# EasyEDA Pro project project.epro, schematic Pakshi
Board Name: Board1; Create Date: 2026-10-31; Page Name: schematic; Project Name: mini dron; Schematic Name: Pakshi; Update Date: 2026-10-31; Company: EasyEDA.com; Page Size: A4; Version: V1.0
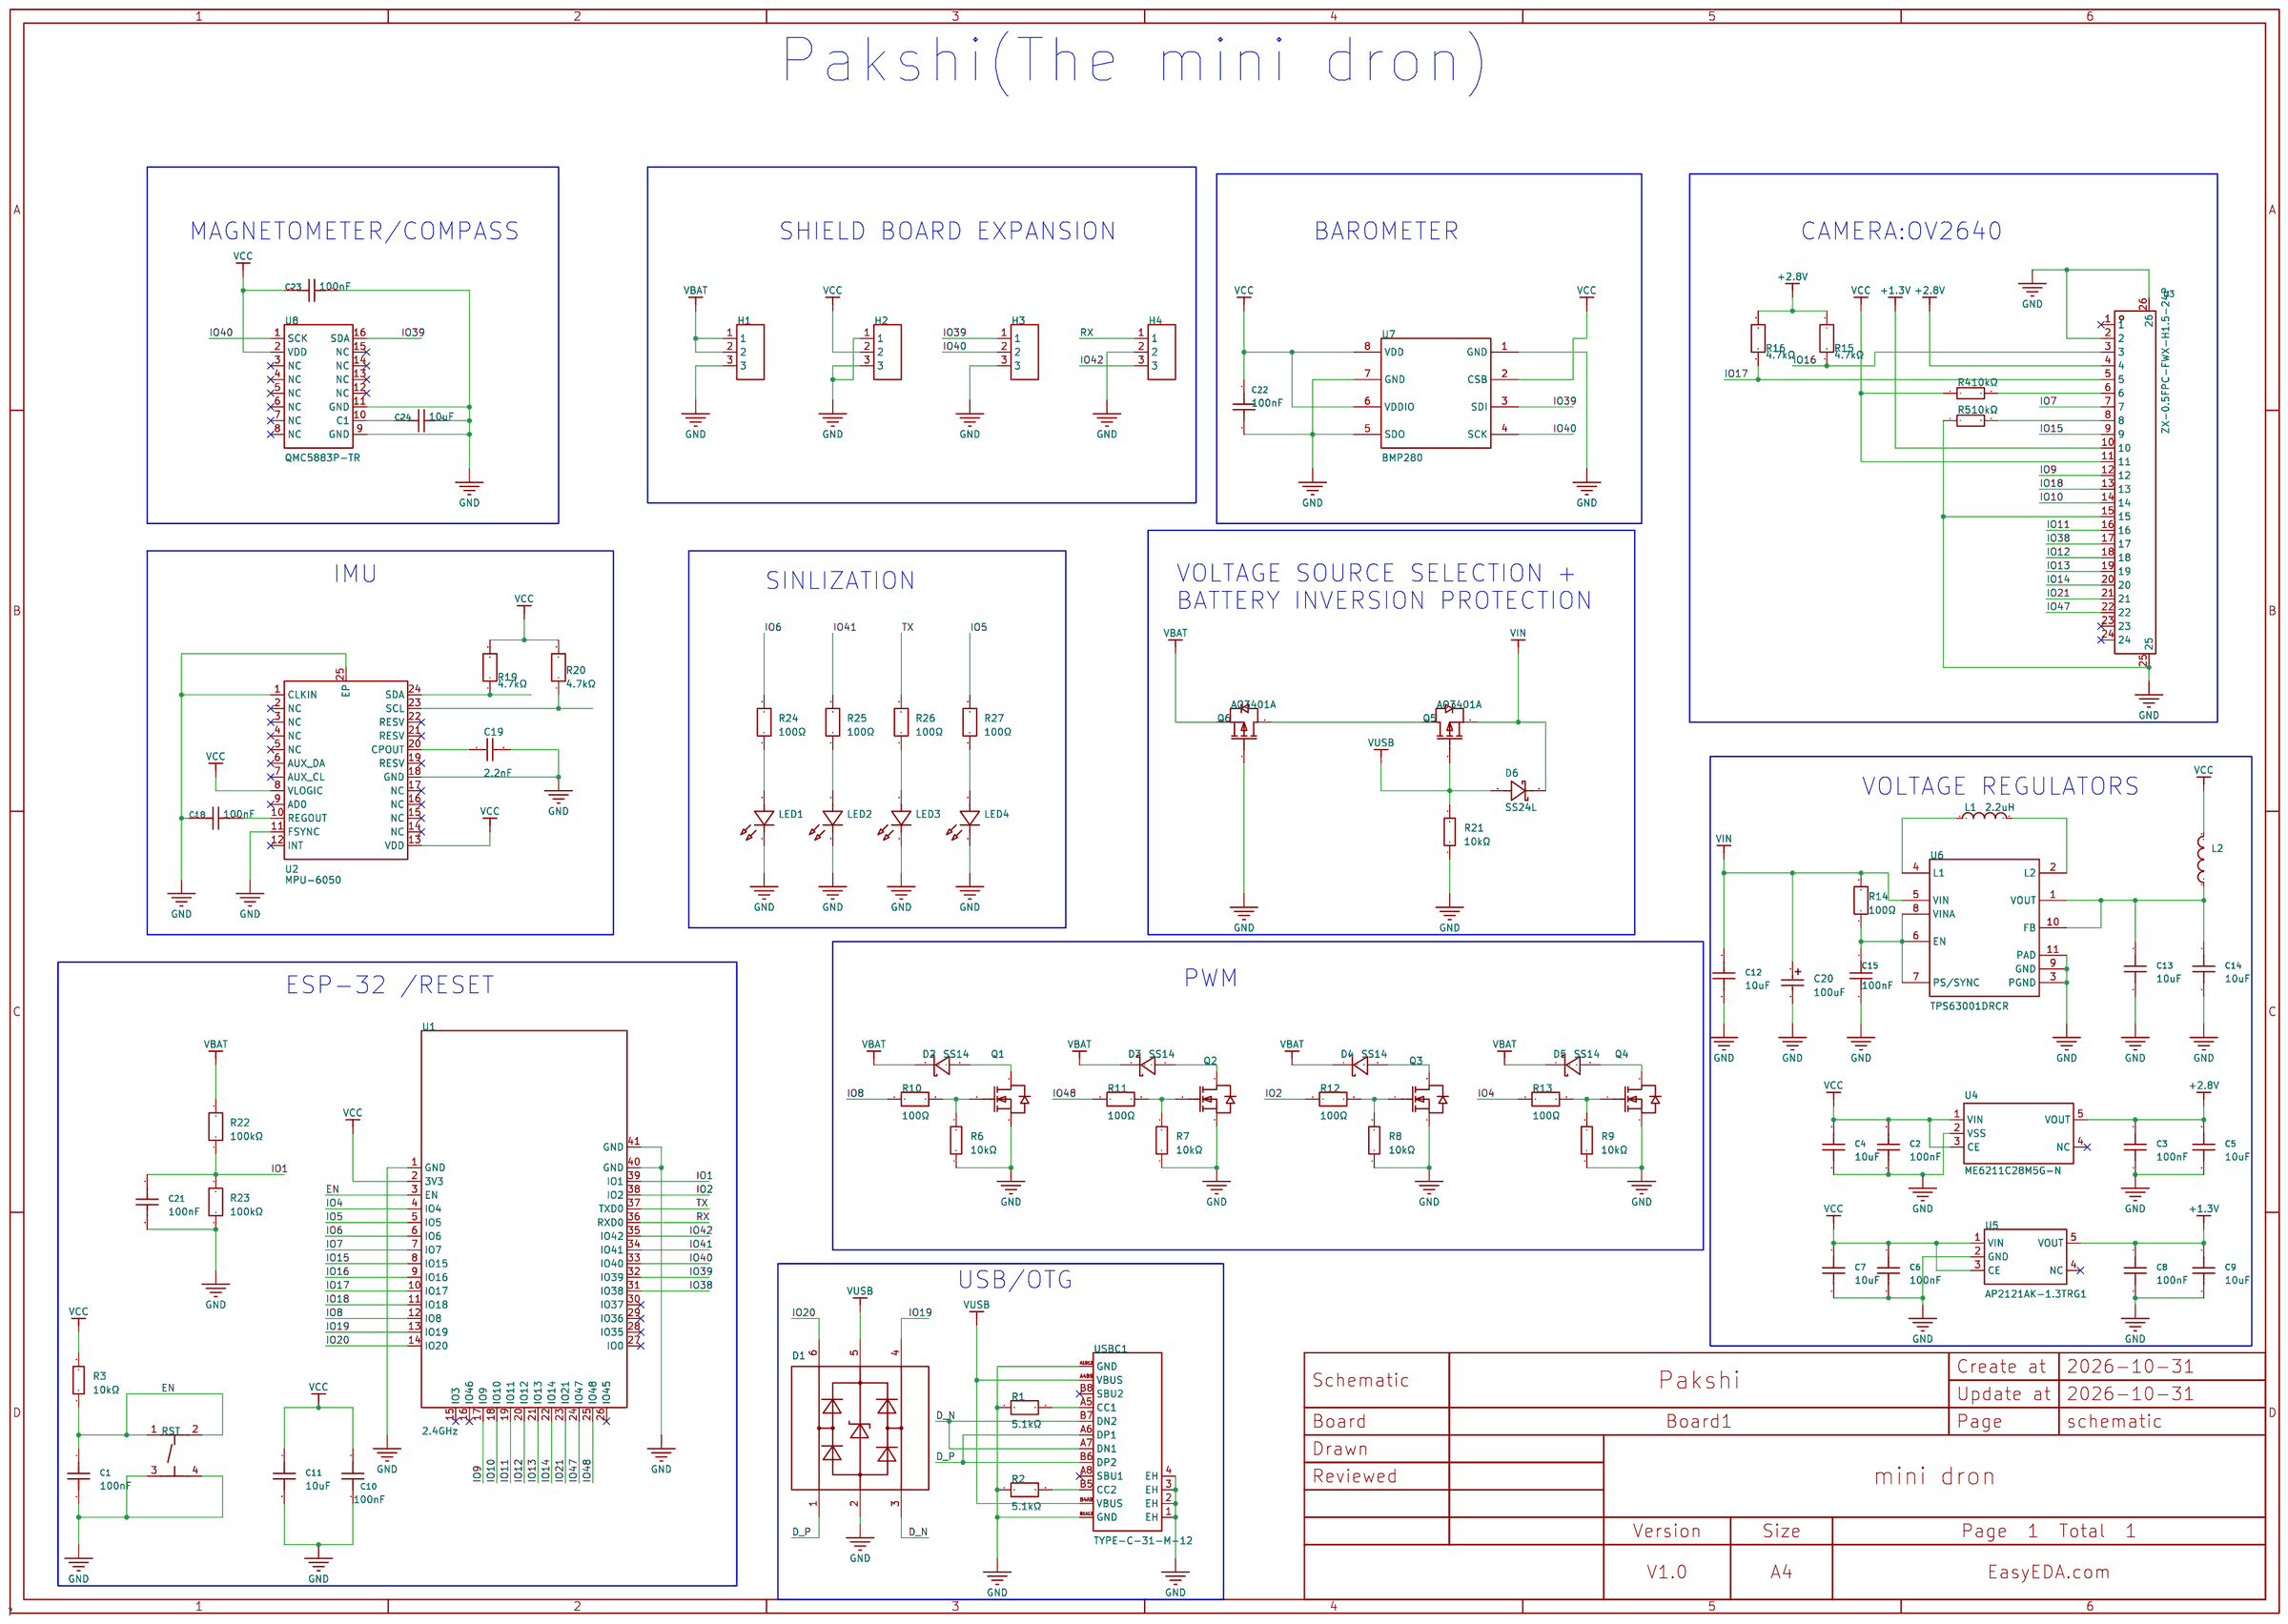
[diagram p0: schematic sheet]

## Parts
C1  100nF  [C0603]
C2  100nF  [C0603]
C3  100nF  [C0603]
C4  10uF  [C0603]
C5  10uF  [C0603]
C6  100nF  [C0603]
C7  10uF  [C0603]
C8  100nF  [C0603]
C9  10uF  [C0603]
C10  100nF  [C0603]
C11  10uF  [C0603]
C12  10uF  [C0603]
C13  10uF  [C0603]
C14  10uF  [C0603]
C15  100nF  [C0603]
C18  100nF  [C0603]
C19  2.2nF  [C0603]
C20  100uF  [CASE-B_3528]
C21  100nF  [C0603]
C22  100nF  [C0603]
C23  100nF  [C0603]
C24  10uF  [C0603]
D1  USBLC6-2SC6  [SOT-23-6_L2.9-W1.6-P0.95-LS2.8-BL]
D2  SS14  [SMA_L4.3-W2.6-LS5.2-RD]
D3  SS14  [SMA_L4.3-W2.6-LS5.2-RD]
D4  SS14  [SMA_L4.3-W2.6-LS5.2-RD]
D5  SS14  [SMA_L4.3-W2.6-LS5.2-RD]
D6  SS24L  [SOD-123FL_L2.8-W1.8-LS3.7-R-RD]
H1  B12720520-3PB0514-H10C43  [HDR-SMD_3P-P1.27-V-M-LS4.2_X1311WVS-R2]
H2  B12720520-3PB0514-H10C43  [HDR-SMD_3P-P1.27-V-M-LS4.2_X1311WVS-R2]
H3  B12720520-3PB0514-H10C43  [HDR-SMD_3P-P1.27-V-M-LS4.2_X1311WVS-R2]
H4  B12720520-3PB0514-H10C43  [HDR-SMD_3P-P1.27-V-M-LS4.2_X1311WVS-R2]
L1  2.2uH  [IND-SMD_L3.0-W3.0_SMNR3015]
L2  BLM18HB121SN1D  [L0603]
LED1  XL-1608SURC-06  [LED0603-RD_RED]
LED2  19-219/GHC-YR2T1B5Y/3T  [LED-SMD_L1.6-W0.8_19-219-GHC-YR2T1B5Y-3T]
LED3  XL-1608SURC-06  [LED0603-RD_RED]
LED4  19-219/GHC-YR2T1B5Y/3T  [LED-SMD_L1.6-W0.8_19-219-GHC-YR2T1B5Y-3T]
Q1  AO3400A  [SOT-23-3_L2.9-W1.3-P1.90-LS2.4-BR]
Q2  AO3400A  [SOT-23-3_L2.9-W1.3-P1.90-LS2.4-BR]
Q3  AO3400A  [SOT-23-3_L2.9-W1.3-P1.90-LS2.4-BR]
Q4  AO3400A  [SOT-23-3_L2.9-W1.3-P1.90-LS2.4-BR]
Q5  AO3401A  [SOT-23_L2.9-W1.3-P1.90-LS2.4-BR]
Q6  AO3401A  [SOT-23_L2.9-W1.3-P1.90-LS2.4-BR]
R1  5.1kΩ  [R0603]
R2  5.1kΩ  [R0603]
R3  10kΩ  [R0603]
R4  10kΩ  [R0603]
R5  10kΩ  [R0603]
R6  10kΩ  [R0603]
R7  10kΩ  [R0603]
R8  10kΩ  [R0603]
R9  10kΩ  [R0603]
R10  100Ω  [R0603]
R11  100Ω  [R0603]
R12  100Ω  [R0603]
R13  100Ω  [R0603]
R14  100Ω  [R0603]
R15  4.7kΩ  [R0603]
R16  4.7kΩ  [R0603]
R19  4.7kΩ  [R0603]
R20  4.7kΩ  [R0603]
R21  10kΩ  [R0603]
R22  100kΩ  [R0603]
R23  100kΩ  [R0603]
R24  100Ω  [R0603]
R25  100Ω  [R0603]
R26  100Ω  [R0603]
R27  100Ω  [R0603]
RST  TS-1187A-B-A-B  [SW-SMD_4P-L5.1-W5.1-P3.70-LS6.5-TL_H1.5]
U1  2.4GHz  [WIRELM-SMD_ESP32-S3-WROOM-1]
U2  MPU-6050  [QFN-24_L4.0-W4.0-P0.50-BL-EP2.7]
U3  ZX-0.5FPC-FWX-H1.5-24P  [FPC-SMD_24P-P0.50_ZX-0.5FPC-FWX-H1.5-24P]
U4  ME6211C28M5G-N  [SOT-23-5_L3.0-W1.7-P0.95-LS2.8-BR]
U5  AP2121AK-1.3TRG1  [SOT-23-5_L2.9-W1.6-P0.95-LS2.8-BL]
U6  TPS63001DRCR  [VSON-10_L3.0-W3.0-P0.50-TL-EP_TPS62410DRCR]
U7  BMP280  [LGA-8_L2.5-W2.0-P0.65_AMP6127]
U8  QMC5883P-TR  [LGA-16_L3.0-W3.0-P0.50-BL_SQ]
USBC1  TYPE-C-31-M-12  [USB-C_SMD-TYPE-C-31-M-12_1]

## Library data of the parts
C1-C3 C6 C8 C10 C15 C18 C21-C23 = CC0603KRX7R7BB104: Capacitance:100nF Tolerance:±10% Tolerance:±10% Voltage Rating:16V Temperature Coefficient:X7R; LCSC Part Name: 100nF ±10% 16V; Supplier Part: C108079; Manufacturer: YAGEO(国巨); Supplier Footprint: 0603; JLCPCB Part Class: Extended Part; Datasheet: https://item.szlcsc.com/datasheet/CC0603KRX7R7BB104/109298.html; Supplier: LCSC; Tolerance: ±10%; Voltage Rating: 16V; Temperature Coefficient: X7R
C4 C5 C7 C9 C11-C14 C24 = GRM188Z71A106MA73D: Capacitance:10uF Tolerance:±20% Tolerance:±20% Voltage Rating:10V Temperature Coefficient:X7R; LCSC Part Name: 10uF ±20% 10V; Supplier Part: C237435; Manufacturer: muRata(村田); Supplier Footprint: 0603; JLCPCB Part Class: Extended Part; Datasheet: https://item.szlcsc.com/datasheet/GRM188Z71A106MA73D/236879.html; Supplier: LCSC; Tolerance: ±20%; Voltage Rating: 10V; Temperature Coefficient: X7R
C19 = CC0603KRX7R9BB222: Capacitance:2.2nF Tolerance:±10% Tolerance:±10% Voltage Rating:50V Temperature Coefficient:X7R; LCSC Part Name: 2.2nF ±10% 50V; Supplier Part: C107082; Manufacturer: YAGEO(国巨); Supplier Footprint: 0603; JLCPCB Part Class: Extended Part; Datasheet: https://item.szlcsc.com/datasheet/CC0603KRX7R9BB222/108298.html; Supplier: LCSC; Tolerance: ±10%; Voltage Rating: 50V; Temperature Coefficient: X7R
C20 = TAJB107M010RNJ: Capacitance:100uF Tolerance:±20% Tolerance:±20% Voltage Rating:10V Equivalent Series Resistance(ESR):1.4Ω@100kHz Operating Temperature:-55℃~+125℃ Operating Temperature:-55℃~+125℃; LCSC Part Name: 100uF ±20% 10V; Supplier Part: C7196; Manufacturer: Kyocera AVX; Supplier Footprint: CASE-B-3528-21(mm); JLCPCB Part Class: Extended Part; Supplier: LCSC; Tolerance: ±20%; Voltage Rating: 10V; Equivalent Series Resistance(ESR): 1.4Ω@100kHz; Operating Temperature: -55℃~+125℃
D1 = USBLC6-2SC6_C7519: Polarity:Unidirectional Reverse Stand-Off Voltage (Vrwm):5.25V Clamping Voltage:17V Peak Pulse Current (Ipp):5A Voltage - Breakdown:6V Reverse Leakage Current (Ir):150nA Number of Channels:2 Operating Temperature:-40℃~+125℃ Operating Temperature:-40℃~+125; LCSC Part Name: 单向ESD 5.25V截止 峰值脉冲电流：5A; Supplier Part: C7519; Manufacturer: ST(意法半导体); Supplier Footprint: SOT-23-6L; JLCPCB Part Class: Extended Part; Datasheet: https://item.szlcsc.com/datasheet/USBLC6-2SC6/7996.html; Supplier: LCSC; Polarity: Unidirectional; Reverse Stand-Off Voltage (Vrwm): 5.25V; Clamping Voltage: 17V; Peak Pulse Current (Ipp): 5A; Voltage - Breakdown: 6V; Reverse Leakage Current (Ir): 150nA; Number of Channels: 2; Operating Temperature: -40℃~+125℃; level of protection: IEC 61000-4-2; Type: ESD; Junction Capacitance: 3.5pF
D2-D5 = SS14_C83852: Voltage - Forward(Vf@If):500mV@1A Voltage - DC Reverse(Vr):40V Current - Rectified:1A Reverse Leakage Current (Ir):200uA@40V Operating Junction Temperature Range:-65℃~+125℃ Operating Junction Temperature Range:-65℃~+125℃ Non-Repetitive Peak Forward Surge; LCSC Part Name: 电压:40V 电流:1A; Supplier Part: C83852; Manufacturer: onsemi(安森美); Supplier Footprint: SMA(DO-214AC); JLCPCB Part Class: Extended Part; Datasheet: https://item.szlcsc.com/datasheet/SS14/85019.html; Supplier: LCSC; Voltage - Forward(Vf@If): 500mV@1A; Voltage - DC Reverse(Vr): 40V; Current - Rectified: 1A; Reverse Leakage Current (Ir): 200uA@40V; Operating Junction Temperature Range: -65℃~+125℃; Non-Repetitive Peak Forward Surge Current: 40A
D6 = SS24L_C2827931: Diode Configuration:Independent Voltage - Forward(Vf@If):500mV@2A Voltage - DC Reverse(Vr):40V Current - Rectified:2A Reverse Leakage Current (Ir):500uA@40V Non-Repetitive Peak Forward Surge Current:50A; LCSC Part Name: 电压:40V 电流:2A; Supplier Part: C2827931; Manufacturer: Hottech(合科泰); Supplier Footprint: SOD-123FL; JLCPCB Part Class: Extended Part; Datasheet: https://item.szlcsc.com/datasheet/SS24L/2974958.html; Supplier: LCSC; Diode Configuration: Independent; Voltage - Forward(Vf@If): 500mV@2A; Voltage - DC Reverse(Vr): 40V; Current - Rectified: 2A; Reverse Leakage Current (Ir): 500uA@40V; Non-Repetitive Peak Forward Surge Current: 50A
H1-H4 = B12720520-3PB0514-H10C43: Pin Structure:1x3P Pitch:1.27mm Circluar Pins/Square Pins:Pin Header Mounting Type:Surface Mount,Vertical Number of Rows:1 Number of Pins:3P Current Rating:1A Length of Mating Pin:4mm Insulation Height:1mm Contact Material:Brass Contact Plating:Gold Opera; LCSC Part Name: 1x3P 间距:1.27mm 方针 立贴; Supplier Part: C51823023; Manufacturer: HMTCONN(华明通); Supplier Footprint: SMD,P=1.27mm(交错脚); JLCPCB Part Class: Extended Part; Datasheet: https://item.szlcsc.com/datasheet/B12720520-3PB0514-H10C43/54487603.html; Supplier: LCSC; Pin Structure: 1x3P; Pitch: 1.27mm; Circluar Pins/Square Pins: Pin Header; Mounting Type: Surface Mount,Vertical; Number of Rows: 1; Number of Pins: 3P; Current Rating: 1A; Length of Mating Pin: 4mm; Insulation Height: 1mm; Contact Material: Brass; Contact Plating: Gold; Operating Temperature: -40℃~+105℃
L1 = ANR3015T2R2M: Inductance:2.2uH Tolerance:±20% Tolerance:±20% Current Rating:2A Current - Saturation(Isat):2A Type:Magnetic Shielded Inductor; LCSC Part Name: 2.2uH ±20% 2A 3x3x1.5mm; Supplier Part: C6364793; Manufacturer: APV(爱普微); Supplier Footprint: SMD,3x3mm; JLCPCB Part Class: Extended Part; Datasheet: https://item.szlcsc.com/datasheet/ANR3015T2R2M/7314195.html; Supplier: LCSC; Tolerance: ±20%; Current Rating: 2A; Current - Saturation(Isat): 2A; Type: Magnetic Shielded Inductor
L2 = BLM18HB121SN1D: Impedance @ Frequency:120Ω@100MHz Tolerance:±25% Tolerance:±25% DC Resistance(DCR):500mΩ Current Rating:200mA Number of Circuits:1 Operating Temperature:-55℃~+125℃ Operating Temperature:-55℃~+125℃; LCSC Part Name: 单路 0603磁珠 阻抗120Ω@100MHz; Supplier Part: C14710; Manufacturer: muRata(村田); Supplier Footprint: 0603; JLCPCB Part Class: Extended Part; Datasheet: https://item.szlcsc.com/datasheet/BLM18HB121SN1D/15380.html; Supplier: LCSC; Impedance @ Frequency: 120Ω@100MHz; Tolerance: ±25%; DC Resistance(DCR): 500mΩ; Current Rating: 200mA; Number of Circuits: 1; Operating Temperature: -55℃~+125℃
LED1 LED3 = XL-1608SURC-06: Lamp Holder Type:1.6mm x 0.8mm square LED Illumination Color:Red Voltage - Forward(Vf):2.3V Voltage - Forward(Vf):2.3V Power(Watts):50mW Forward Current:20mA Wavelength - Dominant:620nm~630nm Wavelength - Dominant:620nm~630nm Peak Wavelength:625nm Peak Wa; LCSC Part Name: 0603红色贴片式发光二极管; Supplier Part: C965799; Manufacturer: XINGLIGHT(成兴光); Supplier Footprint: 0603; JLCPCB Part Class: Extended Part; Datasheet: https://item.szlcsc.com/datasheet/XL-1608SURC-06/1051408.html; Supplier: LCSC; Lamp Holder Type: 1.6mm x 0.8mm square LED; Illumination Color: Red; Voltage - Forward(Vf): 2.3V; Power(Watts): 50mW; Forward Current: 20mA; Wavelength - Dominant: 620nm~630nm; Peak Wavelength: 625nm; Diode Configuration: Discrete Diode; Lens Color: Water Clear; Luminous Intensity: 225mcd; Viewing Angle: 120°; Mounting Style: Top-mount; Operating Temperature: -40℃~+85℃
LED2 LED4 = 19-219/GHC-YR2T1B5Y/3T: Lamp Holder Type:- Illumination Color:Green Voltage - Forward(Vf):2.9V Voltage - Forward(Vf):2.9V Power(Watts):95mW Test Current:5mA Wavelength - Dominant:518nm Wavelength - Dominant:518nm Peak Wavelength:525nm Peak Wavelength:525nm Diode Configuration:Di; LCSC Part Name: 0603正贴式 绿灯(Iv=140~360mcd) @IF=20mA); Supplier Part: C2994781; Manufacturer: EVERLIGHT(亿光); Supplier Footprint: 0603; JLCPCB Part Class: Extended Part; Datasheet: https://www.everlighteurope.com/custom/files/datasheets/DSE-0006814.pdf; Supplier: LCSC; Illumination Color: Green; Voltage - Forward(Vf): 2.9V; Power(Watts): 95mW; Test Current: 5mA; Wavelength - Dominant: 518nm; Peak Wavelength: 525nm; Diode Configuration: Discrete Diode; Lens Color: Water Clear; Luminous Intensity: 360mcd; Viewing Angle: 130°; Operating Temperature: -40℃~+85℃
Q1-Q4 = AO3400A_C20917: Number:1 N-channel Drain to Source Voltage:30V Current - Continuous Drain(Id):5.7A RDS(on):48mΩ@2.5V Pd - Power Dissipation:1.4W Gate Threshold Voltage (Vgs(th)):1.45V Gate Charge(Qg):7nC@10V Input Capacitance(Ciss):630pF Reverse Transfer Capacitance (Crs; LCSC Part Name: N沟道 耐压:30V; Supplier Part: C20917; Manufacturer: AOS; Supplier Footprint: SOT-23; JLCPCB Part Class: Basic Part; Datasheet: https://item.szlcsc.com/datasheet/AO3400A/21629.html; Supplier: LCSC; Number: 1 N-channel; Drain to Source Voltage: 30V; Current - Continuous Drain(Id): 5.7A; RDS(on): 48mΩ@2.5V; Pd - Power Dissipation: 1.4W; Gate Threshold Voltage (Vgs(th)): 1.45V; Gate Charge(Qg): 7nC@10V; Input Capacitance(Ciss): 630pF; Reverse Transfer Capacitance (Crss@Vds): 50pF; Operating Temperature: -55℃~+150℃; Type: N-Channel; Output Capacitance(Coss): 75pF; Vgs: ±12V
Q5 Q6 = AO3401A_C15127: Number:1 P-Channel Drain to Source Voltage:30V Current - Continuous Drain(Id):4A RDS(on):47mΩ@10V；85mΩ@2.5V；60mΩ@4.5V Pd - Power Dissipation:- Gate Threshold Voltage (Vgs(th)):900mV Gate Charge(Qg):14nC@10V Input Capacitance(Ciss):645pF Reverse Transfer C; LCSC Part Name: 1个P沟道 耐压:30V 电流:4A; Supplier Part: C15127; Manufacturer: AOS; Supplier Footprint: SOT-23; JLCPCB Part Class: Basic Part; Datasheet: https://item.szlcsc.com/datasheet/AO3401A/15801.html; Supplier: LCSC; Number: 1 P-Channel; Drain to Source Voltage: 30V; Current - Continuous Drain(Id): 4A; RDS(on): 47mΩ@10V；85mΩ@2.5V；60mΩ@4.5V; Gate Threshold Voltage (Vgs(th)): 900mV; Gate Charge(Qg): 14nC@10V; Input Capacitance(Ciss): 645pF; Reverse Transfer Capacitance (Crss@Vds): 55pF; Output Capacitance(Coss): 80pF
R1 R2 = FRC0603F5101TS: Type:Thick Film Resistor Resistance:5.1kΩ Tolerance:±1% Tolerance:±1% Power(Watts):100mW Voltage-Supply(Max):75V Temperature Coefficient:±100ppm/℃ Temperature Coefficient:±100ppm/℃ Operating Temperature:-55℃~+155℃ Operating Temperature:-55℃~+155℃; LCSC Part Name: 5.1kΩ ±1% 100mW 厚膜电阻; Supplier Part: C2907044; Manufacturer: FOJAN(富捷); Supplier Footprint: 0603; JLCPCB Part Class: Extended Part; Supplier: LCSC; Type: Thick Film Resistor; Tolerance: ±1%; Power(Watts): 100mW; Voltage-Supply(Max): 75V; Temperature Coefficient: ±100ppm/℃; Operating Temperature: -55℃~+155℃
R3-R9 R21 = RC0603FR-0710KL: Type:Thick Film Resistor Resistance:10kΩ Tolerance:±1% Tolerance:±1% Power(Watts):100mW Voltage-Supply(Max):75V Temperature Coefficient:±100ppm/℃ Temperature Coefficient:±100ppm/℃ Operating Temperature:-55℃~+155℃ Operating Temperature:-55℃~+155℃; LCSC Part Name: 厚膜电阻 10kΩ ±1% 100mW; Supplier Part: C98220; Manufacturer: YAGEO(国巨); Supplier Footprint: 0603; JLCPCB Part Class: Extended Part; Datasheet: https://item.szlcsc.com/datasheet/RC0603FR-0710KL/99429.html; Supplier: LCSC; Type: Thick Film Resistor; Tolerance: ±1%; Power(Watts): 100mW; Voltage-Supply(Max): 75V; Temperature Coefficient: ±100ppm/℃; Operating Temperature: -55℃~+155℃
R10-R14 R24-R27 = FRC0603F1000TS: Type:Thick Film Resistor Resistance:100Ω Tolerance:±1% Tolerance:±1% Power(Watts):100mW Voltage-Supply(Max):75V Temperature Coefficient:±100ppm/℃ Temperature Coefficient:±100ppm/℃ Operating Temperature:-55℃~+155℃ Operating Temperature:-55℃~+155℃; LCSC Part Name: 100Ω ±1% 100mW 厚膜电阻; Supplier Part: C2906981; Manufacturer: FOJAN(富捷); Supplier Footprint: 0603; JLCPCB Part Class: Extended Part; Datasheet: https://item.szlcsc.com/datasheet/FRC0603F1000TS/3180494.html; Supplier: LCSC; Type: Thick Film Resistor; Tolerance: ±1%; Power(Watts): 100mW; Voltage-Supply(Max): 75V; Temperature Coefficient: ±100ppm/℃; Operating Temperature: -55℃~+155℃
R15 R16 R19 R20 = FRC0603F4701TS: Type:Thick Film Resistor Resistance:4.7kΩ Tolerance:±1% Tolerance:±1% Power(Watts):100mW Voltage-Supply(Max):75V Temperature Coefficient:±100ppm/℃ Temperature Coefficient:±100ppm/℃ Operating Temperature:-55℃~+155℃ Operating Temperature:-55℃~+155℃; LCSC Part Name: 4.7kΩ ±1% 100mW 厚膜电阻; Supplier Part: C2907034; Manufacturer: FOJAN(富捷); Supplier Footprint: 0603; JLCPCB Part Class: Extended Part; Datasheet: https://item.szlcsc.com/datasheet/FRC0603F4701TS/3180547.html; Supplier: LCSC; Type: Thick Film Resistor; Tolerance: ±1%; Power(Watts): 100mW; Voltage-Supply(Max): 75V; Temperature Coefficient: ±100ppm/℃; Operating Temperature: -55℃~+155℃
R22 R23 = FRC0603F1003TS: Type:Thick Film Resistor Resistance:100kΩ Tolerance:±1% Tolerance:±1% Power(Watts):100mW Voltage-Supply(Max):75V Temperature Coefficient:±100ppm/℃ Temperature Coefficient:±100ppm/℃ Operating Temperature:-55℃~+155℃ Operating Temperature:-55℃~+155℃; LCSC Part Name: 100kΩ ±1% 100mW 厚膜电阻; Supplier Part: C2906980; Manufacturer: FOJAN(富捷); Supplier Footprint: 0603; JLCPCB Part Class: Extended Part; Datasheet: https://item.szlcsc.com/datasheet/FRC0603F1003TS/3180493.html; Supplier: LCSC; Type: Thick Film Resistor; Tolerance: ±1%; Power(Watts): 100mW; Voltage-Supply(Max): 75V; Temperature Coefficient: ±100ppm/℃; Operating Temperature: -55℃~+155℃
RST = TS-1187A-B-A-B: Circuit:SPST Actuator Style:Round Button Operating Force:1.6N Mounting Type:Surface Mount,Vertical Length:5.1mm Width:5.1mm Switch Height:1.5mm with Bracket:Without Bracket Contact Current:50mA Voltage Rating:12V Actuator/Cap Color:Gold With Lamp:No Life:; LCSC Part Name: 5.1*5.1*1.5mm 立贴 轻触开关; Supplier Part: C318884; Manufacturer: XKB Connection(中国星坤); Supplier Footprint: SMD-4P,5.1x5.1mm; JLCPCB Part Class: Basic Part; Datasheet: https://item.szlcsc.com/datasheet/TS-1187A-B-A-B/299976.html; Supplier: LCSC; Circuit: SPST; Actuator Style: Round Button; Operating Force: 1.6N; Mounting Type: Surface Mount,Vertical; Length: 5.1mm; Width: 5.1mm; Switch Height: 1.5mm; with Bracket: Without Bracket; Contact Current: 50mA; Voltage Rating: 12V; Actuator/Cap Color: Gold; With Lamp: No; Life: 100,000 cycles; Operating Temperature: -30℃~+85℃
U1 = ESP32-S3-WROOM-1-N16R8: Utilized IC / Part:ESP32-S3R8 Interface Type:I2C；GPIO；UART；SPI；USB；I2S Frequency:2.4GHz Antenna Type:On-board PCB Antenna Output Power:20.5dBm Output Power:20.5dBm Voltage - Supply:3V~3.6V Voltage - Supply:3V~3.6V Receive  Current:95mA Send  Current:355mA; LCSC Part Name: 不带固件 通用型Wi-Fi+低功耗蓝牙MCU模组; Supplier Part: C2913202; Manufacturer: ESPRESSIF(乐鑫); Supplier Footprint: SMD,25.5x18mm; JLCPCB Part Class: Extended Part; Datasheet: https://item.szlcsc.com/datasheet/ESP32-S3-WROOM-1-N16R8/3198300.html; Supplier: LCSC; Utilized IC / Part: ESP32-S3R8; Interface Type: I2C；GPIO；UART；SPI；USB；I2S; Antenna Type: On-board PCB Antenna; Output Power: 20.5dBm; Voltage - Supply: 3V~3.6V; Receive  Current: 95mA; Send  Current: 355mA; Sensitivity: -103.5dBm; Operating Temperature: -40℃~+65℃
U2 = MPU-6050: Accelerometer Sensing Axis:X,Y,Z Acceleration Measurement Range (MAX):±16g Acceleration Measurement Range (MAX):±16g Gyroscope Sensing Axis:X,Y,Z Gyroscope Measurement Range (MAX):±2000dps Gyroscope Measurement Range (MAX):±2000dps Sensor Type:IMU (accele; Supplier Part: C24112; Manufacturer: TDK InvenSense(应美盛); Supplier Footprint: QFN-24-EP(4x4); JLCPCB Part Class: Extended Part; Datasheet: https://item.szlcsc.com/datasheet/MPU-6050/24852.html; Supplier: LCSC; Accelerometer Sensing Axis: X,Y,Z; Acceleration Measurement Range (MAX): ±16g; Gyroscope Sensing Axis: X,Y,Z; Gyroscope Measurement Range (MAX): ±2000dps; Sensor Type: IMU (accelerometer + gyroscope); Output Bits: 16bit; Interface: I2C; Voltage - Supply: 2.375V~3.46V; Cache Size: 1KB; Standby Current: 5uA; Operating Temperature: -40℃~+85℃; Features: Motion event detection；Synchronization and timestamp
U3 = ZX-0.5FPC-FWX-H1.5-24P: Locking Feature:Hinged Lid Contact Type:Bottom Contact Number of Contacts:24P Pitch:0.5mm Mounting Type:Surface Mount, Right Angle FFC, FCB Thickness:0.3mm FFC, FCB Thickness:0.3mm Height Above Board:1.5mm Contact Material:Copper alloy Contact Plating:Tin; LCSC Part Name: 翻盖式 下接 P数:24P 间距:0.5mm; Supplier Part: C7544628; Manufacturer: Megastar(兆星); Supplier Footprint: SMD,P=0.5mm,卧贴; JLCPCB Part Class: Extended Part; Datasheet: https://item.szlcsc.com/datasheet/ZX-0.5FPC-FWX-H1.5-24P/8652034.html; Supplier: LCSC; Locking Feature: Hinged Lid; Contact Type: Bottom Contact; Number of Contacts: 24P; Pitch: 0.5mm; Mounting Type: Surface Mount, Right Angle; FFC, FCB Thickness: 0.3mm; Height Above Board: 1.5mm; Contact Material: Copper alloy; Contact Plating: Tin; Operating Temperature: -25℃~+85℃; Rated Voltage (Max): 50V
U4 = ME6211C28M5G-N: Output Configuration:Positive Voltage - Supply:6V Output Voltage:2.8V Output Voltage:2.8V Output Current:450mA Power Supply Rejection Ratio (PSRR):70dB@(1kHz) Voltage Dropout:220mV@(200mA) standby current:55uA Noise:50uVrms Features:Enable control Operati; LCSC Part Name: 2.8V 450mA 6V; Supplier Part: C53099; Manufacturer: MICRONE(南京微盟); Supplier Footprint: SOT-23-5; JLCPCB Part Class: Extended Part; Datasheet: https://item.szlcsc.com/datasheet/ME6211C28M5G-N/54115.html; Supplier: LCSC; Output Configuration: Positive; Voltage - Supply: 6V; Output Voltage: 2.8V; Output Current: 450mA; Power Supply Rejection Ratio (PSRR): 70dB@(1kHz); Voltage Dropout: 220mV@(200mA); standby current: 55uA; Noise: 50uVrms; Features: Enable control; Operating Temperature: -40℃~+85℃@(Ta); Output Type: Fixed; Number of Outputs: 1
U5 = AP2121AK-1.3TRG1: Output Configuration:Positive Voltage - Supply:6V Output Voltage:1.3V Output Voltage:1.3V Output Current:300mA Power Supply Rejection Ratio (PSRR):70dB@(1kHz) Voltage Dropout:600mV@(100mA) standby current:25uA Noise:30uVrms Features:Enable control；Short C; LCSC Part Name: 1.3V 300mA 6V; Supplier Part: C6124322; Manufacturer: DIODES(美台); Supplier Footprint: SOT-23-5; JLCPCB Part Class: Extended Part; Datasheet: https://item.szlcsc.com/datasheet/AP2121AK-1.3TRG1/7067237.html; Supplier: LCSC; Output Configuration: Positive; Voltage - Supply: 6V; Output Voltage: 1.3V; Output Current: 300mA; Power Supply Rejection Ratio (PSRR): 70dB@(1kHz); Voltage Dropout: 600mV@(100mA); standby current: 25uA; Noise: 30uVrms; Features: Enable control；Short Circuit Protection；Over Current Protection; Operating Temperature: -40℃~+85℃@(Ta); Output Type: Fixed; Number of Outputs: 1
U6 = TPS63001DRCR: Function:Buck-Boost Voltage - Supply:1.8V~5.5V Voltage - Supply:1.8V~5.5V Output Voltage:3.3V Output Voltage:3.3V Output Current:1.2A Frequency - Switching:1.5MHz Frequency - Switching:1.5MHz Operating Temperature:-40℃~+85℃@(TA) Operating Temperature:-40℃; LCSC Part Name: 升降压型 1.8V~5.5V; Supplier Part: C28060; Manufacturer: TI(德州仪器); Supplier Footprint: VSON-10-EP(3x3); JLCPCB Part Class: Extended Part; Datasheet: https://www.ti.com/cn/lit/ds/symlink/tps63001.pdf; Supplier: LCSC; Function: Buck-Boost; Voltage - Supply: 1.8V~5.5V; Output Voltage: 3.3V; Output Current: 1.2A; Frequency - Switching: 1.5MHz; Operating Temperature: -40℃~+85℃@(TA); Synchronous Rectifier: Yes; Number of Outputs: 1; Topology: Buck-Boost; Quiescent Current: 50uA; Switch tube (built-in/external): Built-in; Output Type: Fixed; Features: Light load efficient mode；Frequency synchronization；Overcurrent Protection；Load disconnect
U7 = BMP280: Pressure range:30Kpa~1.1bar Pressure range:30Kpa~1.1bar Voltage - Supply:1.71V~3.6V Voltage - Supply:1.71V~3.6V Standby Current:300nA Interface:SPI；I2C Module:- Absolute Accuracy:1hpa Relative Accuracy:0.12hpa Features:Standby mode；Integrated ADC and digi; LCSC Part Name: BMP280 停产; Supplier Part: C83291; Manufacturer: Bosch(博世); Supplier Footprint: LGA-8(2x2.5); JLCPCB Part Class: Extended Part; Datasheet: https://item.szlcsc.com/datasheet/BMP280/84455.html; Supplier: LCSC; Pressure range: 30Kpa~1.1bar; Voltage - Supply: 1.71V~3.6V; Standby Current: 300nA; Interface: SPI；I2C; Absolute Accuracy: 1hpa; Relative Accuracy: 0.12hpa; Features: Standby mode；Integrated ADC and digital interface；On-chip temperature output；On-chip calibration and non-volatile storage; Temperature Coefficient of Offset(TCO): 1.5pa/K; Operating Temperature: -40℃~+85℃
U8 = QMC5883P-TR: Supplier Part: C54443364; Supplier Footprint: LGA-16; JLCPCB Part Class: Extended Part; Supplier: LCSC
USBC1 = TYPE-C-31-M-12: Connector Type:Type-C Protocol Standard:- Gender:Female Mounting Type:Surface Mount, Right Angle Number of Contacts:16P Number of Ports:1 Current Rating-Power:5A Voltage Rating:20V Connect-Disconnect Life:10,000 cycles Length:7.35mm Operating Temperature:; LCSC Part Name: Type-C 母 卧贴; Supplier Part: C165948; Manufacturer: 韩国韩荣; Supplier Footprint: SMD; JLCPCB Part Class: Extended Part; Datasheet: https://item.szlcsc.com/datasheet/TYPE-C-31-M-12/177331.html; Supplier: LCSC; Connector Type: Type-C; Gender: Female; Mounting Type: Surface Mount, Right Angle; Number of Contacts: 16P; Number of Ports: 1; Current Rating-Power: 5A; Voltage Rating: 20V; Connect-Disconnect Life: 10,000 cycles; Length: 7.35mm; Operating Temperature: -30℃~+80℃

## Nets
+1.3V: C8.1 C9.1 U3.10 U5.5(VOUT)
+2.8V: C3.1 C5.1 R15.2 R16.2 U3.4 U4.5(VOUT)
GND: C1.2 C2.2 C3.2 C4.2 C5.2 C6.2 C7.2 C8.2 C9.2 C10.2 C11.2 C12.2 C13.2 C14.2 C15.2 C18.2 C19.2 C20.2 C21.2 C22.2 C23.1 C24.1 D1.2 H1.3 H2.1 H2.3 H3.3 H4.2 LED1.1(K) LED2.2(K) LED3.1(K) LED4.2(K) Q1.2(S) Q2.2(S) Q3.2(S) Q4.2(S) Q6.1(G) R1.1 R2.1 R5.1 R6.1 R7.1 R8.1 R9.1 R21.1 R23.1 RST.3(C) RST.4(D) U1.1(GND) U1.40(GND) U1.41(GND) U2.1(CLKIN) U2.11(FSYNC) U2.18(GND) U2.25(EP) U3.2 U3.15 U3.25 U3.26 U4.2(VSS) U5.2(GND) U6.3(PGND) U6.9(GND) U6.11(PAD) U7.1(GND) U7.5(SDO) U7.7(GND) U8.9(GND) U8.11(GND) USBC1.1(EH) USBC1.2(EH) USBC1.3(EH) USBC1.4(EH) USBC1.A1B12(GND) USBC1.B1A12(GND)
VBAT: D2.1(K) D3.1(K) D4.1(K) D5.1(K) H1.1 H1.2 Q6.2(S) R22.2
VCC: C2.1 C4.1 C6.1 C7.1 C10.1 C11.1 C22.1 C23.2 H2.2 L2.2 R3.2 R4.1 R19.2 R20.2 U1.2(3V3) U2.8(VLOGIC) U2.13(VDD) U3.11 U4.1(VIN) U4.3(CE) U5.1(VIN) U5.3(CE) U7.2(CSB) U7.6(VDDIO) U7.8(VDD) U8.2(VDD)
VIN: C12.1 C20.1 D6.2(K) Q5.2(S) R14.2 U6.5(VIN)
D_N: D1.3 USBC1.A7(DN1) USBC1.B7(DN2)
D_P: D1.1 USBC1.A6(DP1) USBC1.B6(DP2)
EN: C1.1 R3.1 RST.1(A) RST.2(B) U1.3(EN)
IO1: C21.1 R22.1 R23.2 U1.39(IO1)
IO2: R12.1 U1.38(IO2)
IO4: R13.1 U1.4(IO4)
IO5: R27.2 U1.5(IO5)
IO6: R24.2 U1.6(IO6)
IO7: U1.7(IO7) U3.7
IO8: R10.1 U1.12(IO8)
IO9: U1.17(IO9) U3.12
IO10: U1.18(IO10) U3.14
IO11: U1.19(IO11) U3.16
IO12: U1.20(IO12) U3.18
IO13: U1.21(IO13) U3.19
IO14: U1.22(IO14) U3.20
IO15: U1.8(IO15) U3.9
IO16: R15.1 U1.9(IO16) U3.3
IO17: R16.1 U1.10(IO17) U3.5
IO18: U1.11(IO18) U3.13
IO19: D1.4 U1.13(IO19)
IO20: D1.6 U1.14(IO20)
IO21: U1.23(IO21) U3.21
IO38: U1.31(IO38) U3.17
IO39: H3.1 U1.32(IO39) U7.3(SDI) U8.16(SDA)
IO40: H3.2 U1.33(IO40) U7.4(SCK) U8.1(SCK)
IO41: R25.2 U1.34(IO41)
IO42: H4.3 U1.35(IO42)
IO47: U1.24(IO47) U3.22
IO48: R11.1 U1.25(IO48)
RX: H4.1 U1.36(RXD0)
TX: R26.2 U1.37(TXD0)
VUSB: D1.5 D6.1(A) Q5.1(G) R21.2 USBC1.A4B9(VBUS) USBC1.B4A9(VBUS)
$1N2: C24.2 U8.10(C1)
$1N29: R4.2 U3.6
$1N30: R5.2 U3.8
$1N46: C18.1 U2.10(REGOUT)
$1N48: C19.1 U2.20(CPOUT)
$1N51: R20.1 U2.23(SCL)
$1N52: R19.1 U2.24(SDA)
$1N54: LED1.2(A) R24.1
$1N55: LED2.1(A) R25.1
$1N56: LED3.2(A) R26.1
$1N57: LED4.1(A) R27.1
$1N72: Q5.3(D) Q6.3(D)
$1N85: C15.1 R14.1 U6.6(EN) U6.7(PS/SYNC) U6.8(VINA)
$1N88: L1.1 U6.4(L1)
$1N89: L1.2 U6.2(L2)
$1N91: C13.1 C14.1 L2.1 U6.1(VOUT) U6.10(FB)
$1N130: R1.2 USBC1.A5(CC1)
$1N131: R2.2 USBC1.B5(CC2)
$1N143: D2.2(A) Q1.3(D)
$1N145: Q1.1(G) R6.2 R10.2
$1N148: Q2.1(G) R7.2 R11.2
$1N150: D3.2(A) Q2.3(D)
$1N153: Q3.1(G) R8.2 R12.2
$1N155: D4.2(A) Q3.3(D)
$1N158: Q4.1(G) R9.2 R13.2
$1N160: D5.2(A) Q4.3(D)

Not connected (* = marked no-connect by the designer): U1 15(IO3)* 16(IO46)* 26(IO45)* 27(IO0)* 28(IO35)* 29(IO36)* 30(IO37)*; U2 2(NC)* 3(NC)* 4(NC)* 5(NC)* 6(AUX_DA)* 7(AUX_CL)* 9(AD0)* 12(INT)* 14(NC)* 15(NC)* 16(NC)* 17(NC)* 19(RESV)* 21(RESV)* 22(RESV)*; U3 1* 23* 24*; U4 4(NC)*; U5 4(NC)*; U8 3(NC)* 4(NC)* 5(NC)* 6(NC)* 7(NC)* 8(NC)* 12(NC)* 13(NC)* 14(NC)* 15(NC)*; USBC1 A8(SBU1)* B8(SBU2)*

## Notes on the sheet
- Pakshi(The mini dron)
- MAGNETOMETER/COMPASS
- SHIELD BOARD EXPANSION
- BAROMETER
- CAMERA:OV2640
- VOLTAGE SOURCE SELECTION +
  BATTERY INVERSION PROTECTION
- IMU
- SINLIZATION
- VOLTAGE REGULATORS
- ESP-32 /RESET
- PWM
- USB/OTG
